# Altium schematic sheet OPA.schdoc
size 297 x 209 mm; Symbol: Drawing-Symbol_A4; Company: 上海道尔汇控智能科技有限公司; Version: V1.2; Page Size: A4; @Project Name: YTM32; @Page Count: 5; @Update Date: 2025-12-22; @Create Date: 2025-10-25; @Schematic Name: YTM32_MotorControl; @Page No: 2; @Page Name: OPA; @Create Time: 03:17:48; @Update Time: 01:04:27; Border: 1; Width: 1170; Height: 825; Region Start: 1; X Region Count: 6; Y Region Count: 4; Blade Width: 10; Title Block Position: 3; @Board Name: YTM32_MotorControl; Device: Drawing-Symbol_A4
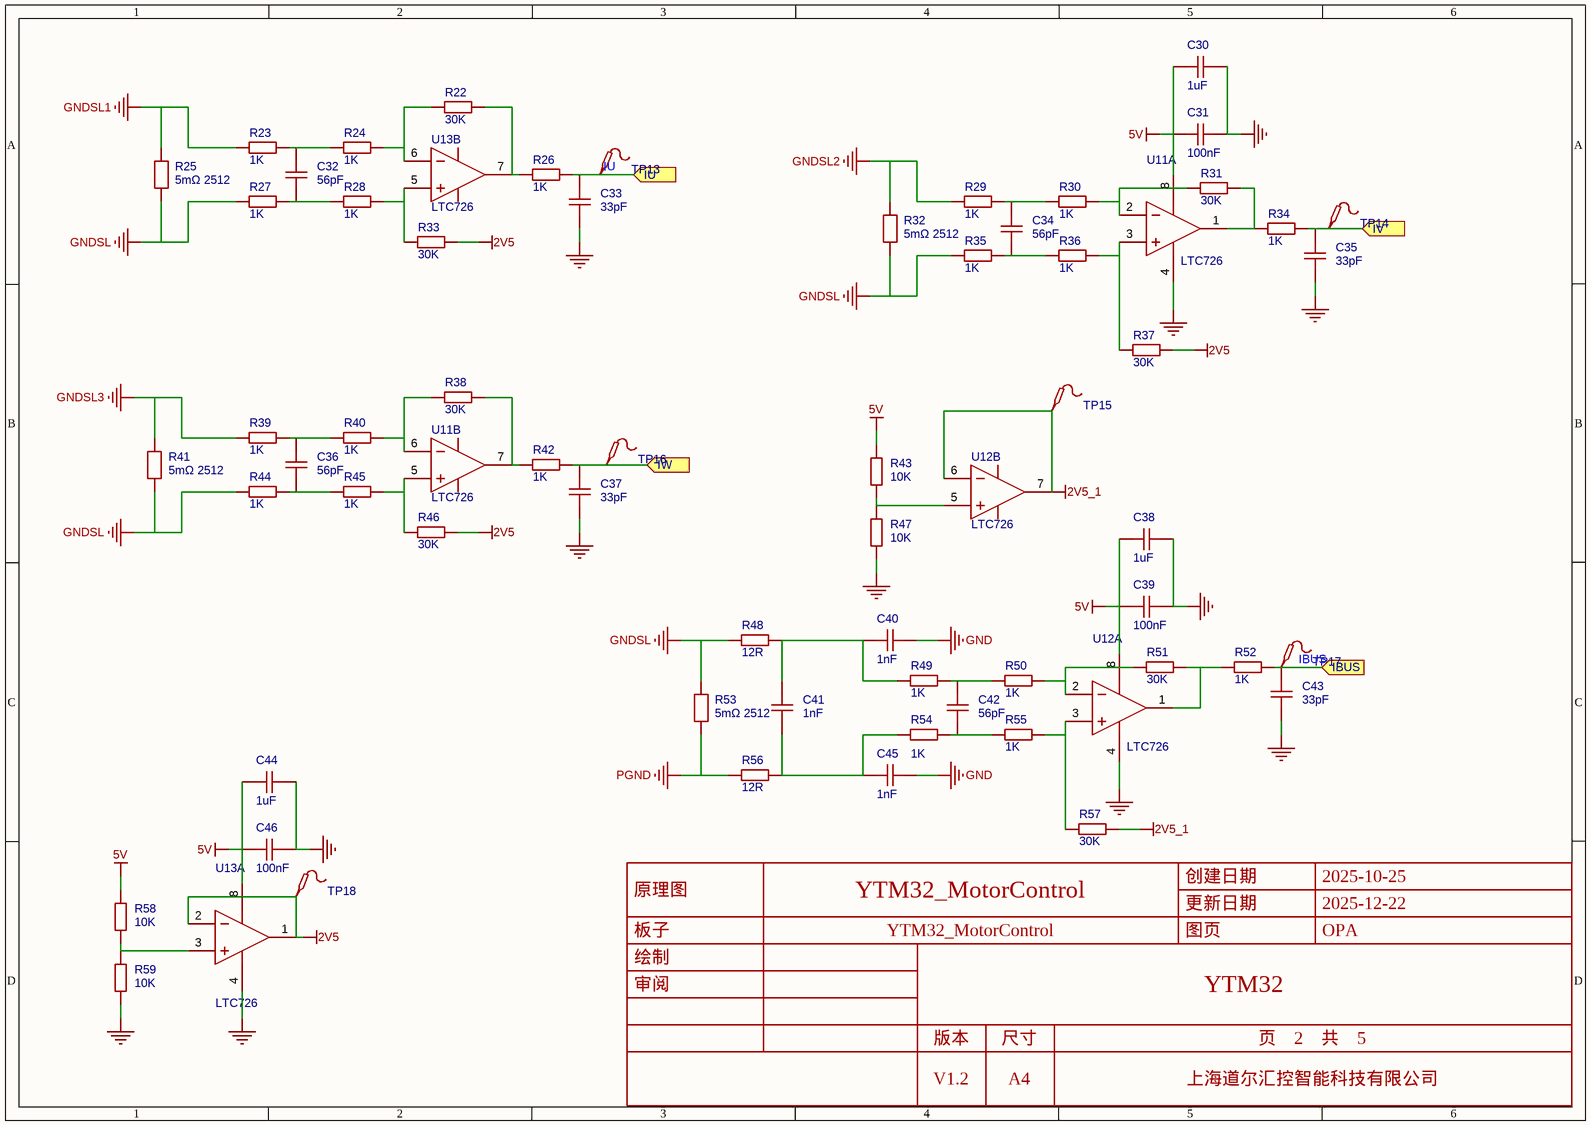
[diagram p0: OPA.schdoc]

## Parts
C30  1uF  [C0603]
C31  100nF  [C0603]
C32  56pF  [C0603]
C33  33pF  [C0603]
C34  56pF  [C0603]
C35  33pF  [C0603]
C36  56pF  [C0603]
C37  33pF  [C0603]
C38  1uF  [C0603]
C39  100nF  [C0603]
C40  1nF  [C0603]
C41  1nF  [C0603]
C42  56pF  [C0603]
C43  33pF  [C0603]
C44  1uF  [C0603]
C45  1nF  [C0603]
C46  100nF  [C0603]
R22  30K  [R0603]
R23  1K  [R0603]
R24  1K  [R0603]
R25  5mΩ 2512  [R2512]
R26  1K  [R0603]
R27  1K  [R0603]
R28  1K  [R0603]
R29  1K  [R0603]
R30  1K  [R0603]
R31  30K  [R0603]
R32  5mΩ 2512  [R2512]
R33  30K  [R0603]
R34  1K  [R0603]
R35  1K  [R0603]
R36  1K  [R0603]
R37  30K  [R0603]
R38  30K  [R0603]
R39  1K  [R0603]
R40  1K  [R0603]
R41  5mΩ 2512  [R2512]
R42  1K  [R0603]
R43  10K  [R0603]
R44  1K  [R0603]
R45  1K  [R0603]
R46  30K  [R0603]
R47  10K  [R0603]
R48  12R  [R0603]
R49  1K  [R0603]
R50  1K  [R0603]
R51  30K  [R0603]
R52  1K  [R0603]
R53  5mΩ 2512  [R2512]
R54  1K  [R0603]
R55  1K  [R0603]
R56  12R  [R0603]
R57  30K  [R0603]
R58  10K  [R0603]
R59  10K  [R0603]
TP13  (no value)  [Test-Point-0.5mm]
TP14  (no value)  [Test-Point-0.5mm]
TP15  (no value)  [Test-Point-0.5mm]
TP16  (no value)  [Test-Point-0.5mm]
TP17  (no value)  [Test-Point-0.5mm]
TP18  (no value)  [Test-Point-0.5mm]
U11  LTC726  [SOP-8_L4.9-W3.9-P1.27-LS6.0-BL]  (parts A,B of 2)
U12  LTC726  [SOP-8_L4.9-W3.9-P1.27-LS6.0-BL]  (parts A,B of 2)
U13  LTC726  [SOP-8_L4.9-W3.9-P1.27-LS6.0-BL]  (parts A,B of 2)

## Ports
IBUS (in), IU (in), IV (in), IW (in)

## Nets
2V5: R33.1 R37.1 R46.1 TP18.1 U13.1(OUTA) U13.2(-INA)
2V5_1: R57.1 TP15.1 U12.6(-IN6) U12.7(OUTB)
5V: C30.2 C31.2 C38.2 C39.2 C44.2 C46.2 R43.2 R58.2 U11.8(+VS) U12.8(+VS) U13.8(+VS)
GND: C30.1 C31.1 C33.2 C35.2 C37.2 C38.1 C39.1 C40.2 C43.2 C44.1 C45.2 C46.1 R47.1 R59.1 U11.4(-VS) U12.4(-VS) U13.4(-VS)
GNDSL: R25.1 R27.1 R32.1 R35.1 R41.1 R44.1 R48.2 R53.2
GNDSL1: R23.1 R25.2
GNDSL2: R29.1 R32.2
GNDSL3: R39.1 R41.2
PGND: R53.1 R56.2
IBUS: C43.1 R52.1 TP17.1 ; port IBUS
IU: C33.1 R26.1 TP13.1 ; port IU
IV: C35.1 R34.1 TP14.1 ; port IV
IW: C37.1 R42.1 TP16.1 ; port IW
NetC32_1: C32.1 R23.2 R24.1
NetC32_2: C32.2 R27.2 R28.1
NetC34_1: C34.1 R29.2 R30.1
NetC34_2: C34.2 R35.2 R36.1
NetC36_1: C36.1 R39.2 R40.1
NetC36_2: C36.2 R44.2 R45.1
NetC40_1: C40.1 C41.2 R48.1 R49.1
NetC41_1: C41.1 C45.1 R54.1 R56.1
NetC42_1: C42.1 R49.2 R50.1
NetC42_2: C42.2 R54.2 R55.1
NetR22_1: R22.1 R26.2 U13.7(OUTB)
NetR22_2: R22.2 R24.2 U13.6(-IN6)
NetR28_2: R28.2 R33.2 U13.5(+INB)
NetR30_2: R30.2 R31.2 U11.2(-INA)
NetR31_1: R31.1 R34.2 U11.1(OUTA)
NetR36_2: R36.2 R37.2 U11.3(+INA)
NetR38_1: R38.1 R42.2 U11.7(OUTB)
NetR38_2: R38.2 R40.2 U11.6(-IN6)
NetR43_1: R43.1 R47.2 U12.5(+INB)
NetR45_2: R45.2 R46.2 U11.5(+INB)
NetR50_2: R50.2 R51.2 U12.2(-INA)
NetR51_1: R51.1 R52.2 U12.1(OUTA)
NetR55_2: R55.2 R57.2 U12.3(+INA)
NetR58_1: R58.1 R59.2 U13.3(+INA)

## Notes on the sheet
- 创建日期
- 2025-10-25
- 原理图
- 板子
- YTM32_MotorControl
- 更新日期
- 图页
- 2025-12-22
- OPA
- 绘制
- 审阅
- YTM32
- 版本
- V1.2
- 尺寸
- A4
- 页    2    共    5
- 上海道尔汇控智能科技有限公司

## Library data of the parts
C30-C46 = CAP_0603: ConvertToPcb: yes; SymbolName: CapAcitance; ModelId: ac125912035d415993ca9572d50418b1; ModelName: C0603_L1.6-W0.8-H0.8; ModelTransform: 62.992,31.496,0,0,0,0,0,0,0; Device: CAP_0603; AddInBom: yes; Supplier Footprint: 0603; FootprintName: C0603
  C30 C38 C44: Value: 1uF
  C31 C39 C46: Value: 100nF
  C32 C34 C36 C42: Value: 56pF
  C33 C35 C37 C43: Value: 33pF
  C40 C41 C45: Value: 1nF
R22-R24 R26-R31 R33-R40 R42-R52 R54-R59 = Res_0603: Symbol: 电阻; ConvertToPcb: yes; ModelId: fc143cca1e79419f9cd78b61e9279f08; ModelTransform: 31.8897,63.7794,0,90,0,0,0,0,0; Device: Res_0603; AddInBom: yes; Supplier Footprint: 0603; FootprintName: R0603; ModelName: R0603
  R22 R31 R33 R37 R38 R46 R51 R57: Value: 30K
  R23 R24 R26-R30 R34-R36 R39 R40 R42 R44 R45 R49 R50 R52 R54 R55: Value: 1K
  R43 R47 R58 R59: Value: 10K
  R48 R56: Value: 12R
R25 R32 R41 R53 = RE2512F3R010: 电阻类型:采样电阻；合金电阻;阻值:10mΩ;精度:±1%;功率:3W;温度系数:±50ppm/℃;; Manufacturer: JIERR(捷而瑞); AddInBom: yes; ModelId: 954b67263d9e4f3582d8de3f8c846421; ModelName: R2512_L6.3-W3.2-H0.6; ModelTransform: 248.031,125.984,0,0,0,0,-0.0005,0,0; Tolerance: ±1%; Power(Watts): 3W; Symbol: RE2512F3R010; Value: 5mΩ 2512; Device: RE2512F3R010; LCSC Part Name: 10mΩ 3W 2512 ±1%; ManufacturerPart: RE2512F3R010; Supplier Footprint: 2512; JLCPCB Part Class: 扩展库; Datasheet: https://item.szlcsc.com/datasheet/RE2512F3R010/49133292.html; Supplier: LCSC; ConvertToPcb: yes; FootprintName: R2512; Type: 采样电阻；合金电阻; Temperature Coefficient: ±50ppm/℃
TP13-TP18 = Test-Point: Test Point 测试点; AddInBom: yes; Device: Test-Point; ConvertToPcb: yes; SymbolName: Test-Point; FootprintName: Test-Point-0.5mm
U11-U13 = TP2412-SR: Manufacturer: 3PEAK; Relevance: []; AddInBom: yes; ModelId: 75c24a7891ee4dd6bdac16a7163ff87e; ModelName: SOP-8_L4.9-W3.9-P1.27-LS6.0-BL-1; ModelTransform: 192.913,236.22,0,0,0,0,0,0,0; Manufacturer Part: LTC726; Symbol: TP2412-SR; Device: TP2412-SR; LCSC Part Name: TP2412-SR; SupplierPart: C248589; Supplier Footprint: SOP-8; JLCPCB Part Class: 扩展库; Datasheet: https://atta.szlcsc.com/upload/public/pdf/source/20180820/C248721_8FB7A558D57D95F91E07EB3745FAAFBB.pdf; Supplier: LCSC; ConvertToPcb: yes; FootprintName: SOP-8_L4.9-W3.9-P1.27-LS6.0-BL